# Altium schematic sheet Controller-Sheet-2.SchDoc
size 420 x 297 mm; SheetNumber: 4; SheetTotal: 15
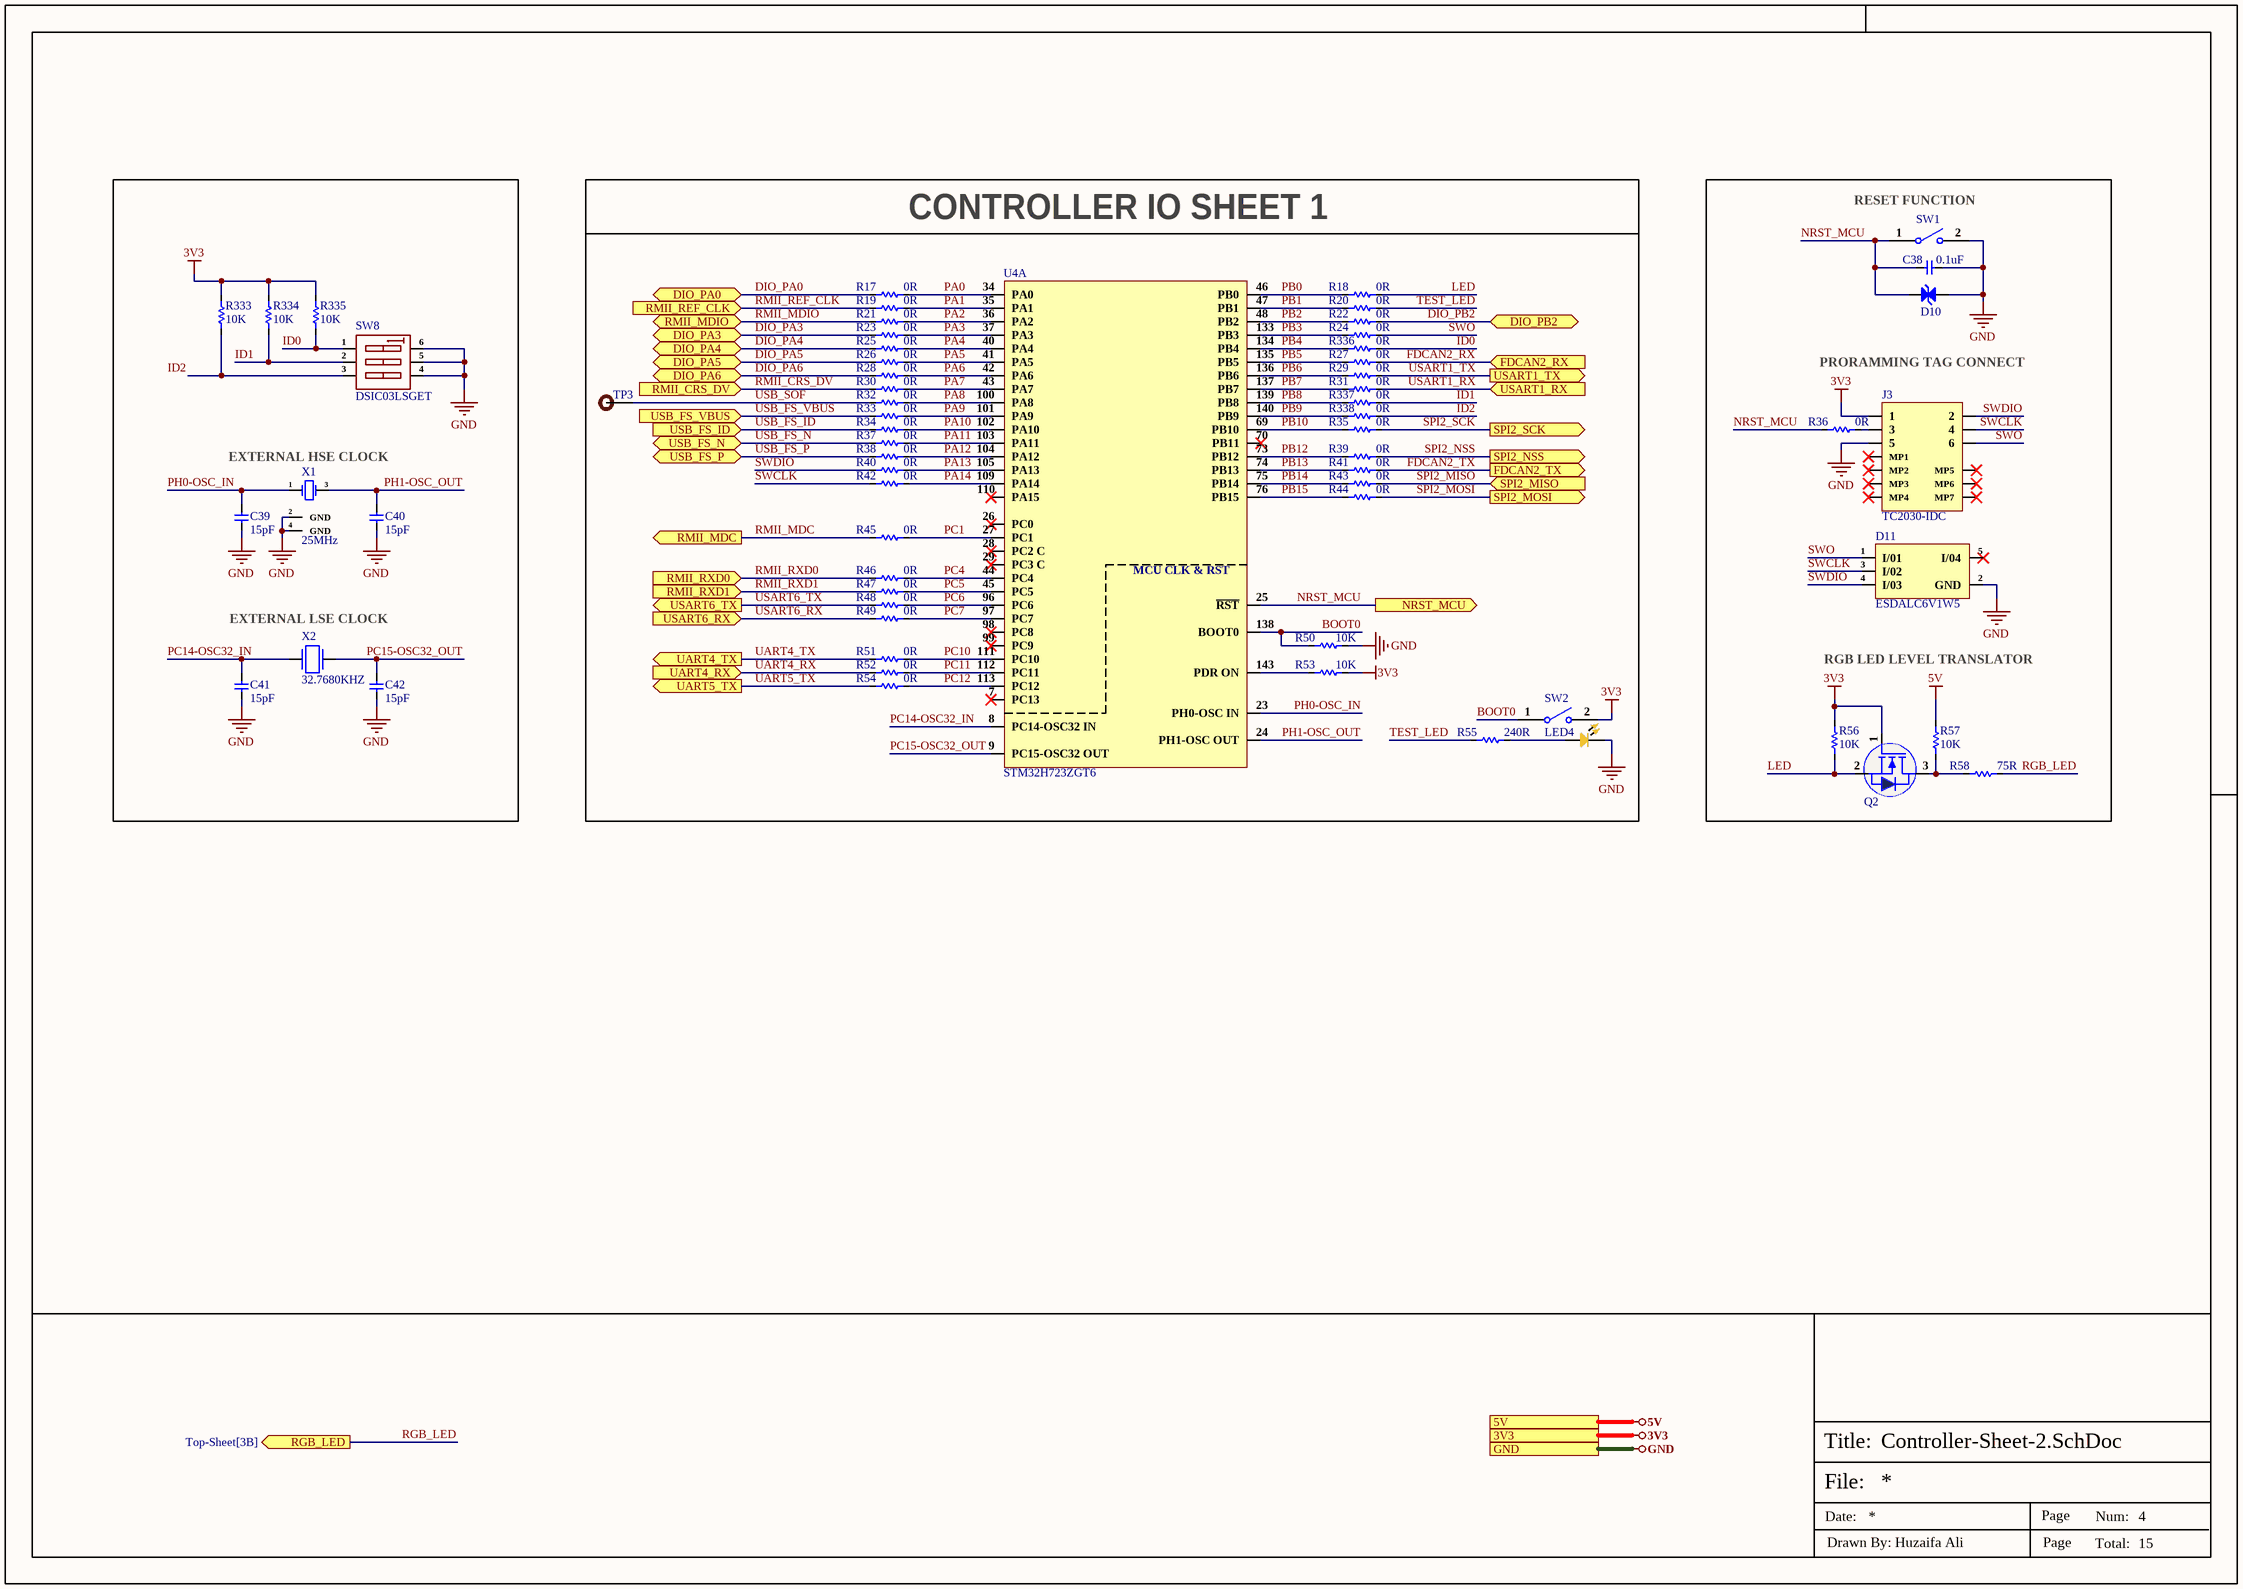
[diagram p0: Controller-Sheet-2.SchDoc]

## Parts
C38  0.1uF  [Cap-0402]
C39  15pF  [Cap-0201]
C40  15pF  [Cap-0201]
C41  15pF  [Cap-0201]
C42  15pF  [Cap-0201]
D10  ESDM2033MX4T5G  [DFN-2(0.3x0.6)]  (value not drawn)
D11  ESDALC6V1W5  [SOT-323-5]
J3  TC2030-IDC  [TC2030-IDC_]
LED4  Yellow  [LED-0603]  (value not drawn)
Q2  Si2302CDS  [Sot-23]  (value not drawn)
R17  0R  [Res-0402]
R18  0R  [Res-0402]
R19  0R  [Res-0402]
R20  0R  [Res-0402]
R21  0R  [Res-0402]
R22  0R  [Res-0402]
R23  0R  [Res-0402]
R24  0R  [Res-0402]
R25  0R  [Res-0402]
R26  0R  [Res-0402]
R27  0R  [Res-0402]
R28  0R  [Res-0402]
R29  0R  [Res-0402]
R30  0R  [Res-0402]
R31  0R  [Res-0402]
R32  0R  [Res-0402]
R33  0R  [Res-0402]
R34  0R  [Res-0402]
R35  0R  [Res-0402]
R36  0R  [Res-0402]
R37  0R  [Res-0402]
R38  0R  [Res-0402]
R39  0R  [Res-0402]
R40  0R  [Res-0402]
R41  0R  [Res-0402]
R42  0R  [Res-0402]
R43  0R  [Res-0402]
R44  0R  [Res-0402]
R45  0R  [Res-0402]
R46  0R  [Res-0402]
R47  0R  [Res-0402]
R48  0R  [Res-0402]
R49  0R  [Res-0402]
R50  10K  [Res-0402]
R51  0R  [Res-0402]
R52  0R  [Res-0402]
R53  10K  [Res-0402]
R54  0R  [Res-0402]
R55  240R  [Res-0402]
R56  10K  [Res-0402]
R57  10K  [Res-0402]
R58  75R  [Res-0402]
R333  10K  [Res-0402]
R334  10K  [Res-0402]
R335  10K  [Res-0402]
R336  0R  [Res-0402]
R337  0R  [Res-0402]
R338  0R  [Res-0402]
SW1  B3U-1000P  [B3U-1000P]  (value not drawn)
SW2  B3U-1000P  [B3U-1000P]  (value not drawn)
SW8  DSIC03LSGET  [DSIC03LSGET]
TP3  TEST POINT 0.5mm Dia  [Test-point - 0.5mm]  (value not drawn)  (no BOM)
U4  STM32H723ZGT6  [LQFP-144(20x20)]  (part A of 3)
X1  25MHz  [Q22FA12800090]
X2  32.7680KHZ  [NX3215SA-32.768K-STD-MUA-8_]

## Blocks framed on the sheet
CONTROLLER IO SHEET 1: LED4 R17-R35 R37-R55 R336-R338 SW2 TP3 U4

## Ports
3V3 (see Top-Sheet[3A], Buttons-Lights-Sensors-Sheet[4D], CAN-Sheet[5D], Controller-Sheet-1[4D], EtherCAT-Sheet[1D], Ethernet-PHY-Sheet[4D], Power-Sheet[4D], RS232-Sheet[5D], RS485-Sheet[5D], USB-Sheet[4D], VFD-Support-Sheet[4D]), 5V (see Top-Sheet[3A], Buttons-Lights-Sensors-Sheet[4D], CAN-Sheet[5D], Power-Sheet[4D], RS232-Sheet[5D], RS485-Sheet[5D], USB-Sheet[4D], VFD-Support-Sheet[4D]), DIO_PA0 (bidir, see Top-Sheet[4A]), DIO_PA3 (bidir, see Top-Sheet[4B]), DIO_PA4 (bidir, see Top-Sheet[3A]), DIO_PA5 (bidir, see Top-Sheet[3A]), DIO_PA6 (bidir, see Top-Sheet[4B]), DIO_PB2 (bidir, see Top-Sheet[4B]), FDCAN2_RX (in, see Top-Sheet[3B]), FDCAN2_TX (out, see Top-Sheet[3B]), GND (see Top-Sheet[3A], Buttons-Lights-Sensors-Sheet[4D], CAN-Sheet[6D], Controller-Sheet-1[4D], Controller-Sheet-3[4D], EtherCAT-Sheet[1D], Ethernet-PHY-Sheet[4D], Extra-DIOs[4D], Power-Sheet[4D], RS232-Sheet[5D], RS485-Sheet[5D], USB-Sheet[4D], VFD-Support-Sheet2[4D], VFD-Support-Sheet[4D]), NRST_MCU (out, see Top-Sheet[3B]), RGB_LED (out, see Top-Sheet[3B]), RMII_CRS_DV (in, see Top-Sheet[3B]), RMII_MDC (out, see Top-Sheet[3B]), RMII_MDIO (bidir, see Top-Sheet[3B]), RMII_REF_CLK (in, see Top-Sheet[3B]), RMII_RXD0 (in, see Top-Sheet[3B]), RMII_RXD1 (in, see Top-Sheet[3B]), SPI2_MISO (in, see Top-Sheet[3A]), SPI2_MOSI (out, see Top-Sheet[3A]), SPI2_NSS (out, see Top-Sheet[3A]), SPI2_SCK (out, see Top-Sheet[3A]), UART4_RX (in, see Top-Sheet[4A]), UART4_TX (out, see Top-Sheet[4A]), UART5_TX (out, see Top-Sheet[3A]), USART1_RX (in, see Top-Sheet[4B]), USART1_TX (out, see Top-Sheet[4B]), USART6_RX (in, see Top-Sheet[3A]), USART6_TX (out, see Top-Sheet[3A]), USB_FS_ID (in, see Top-Sheet[4A], USB-Sheet[1D]), USB_FS_N (bidir, see Top-Sheet[4A], USB-Sheet[1D]), USB_FS_P (bidir, see Top-Sheet[4A], USB-Sheet[1D]), USB_FS_VBUS (in, see Top-Sheet[4A], USB-Sheet[1D])

## Nets
3V3: J3.1 Q2.1(G) R53.1 R56.2 R333.2 R334.2 R335.2 SW2.2 ; port 3V3
5V: R57.2 ; port 5V
GND: C38.1 C39.1 C40.1 C41.1 C42.1 D10.1(A) D11.2(GND) J3.5 LED4.2 R50.1 SW1.2 SW8.4(B3) SW8.5(B2) SW8.6(B1) X1.2(GND) X1.4(GND) ; port GND
BOOT0: R50.2 SW2.1 U4.138(BOOT0)
DIO_PA0: R17.2 ; port DIO_PA0
DIO_PA3: R23.2 ; port DIO_PA3
DIO_PA4: R25.2 ; port DIO_PA4
DIO_PA5: R26.2 ; port DIO_PA5
DIO_PA6: R28.2 ; port DIO_PA6
DIO_PB2: R22.1 ; port DIO_PB2
FDCAN2_RX: R27.1 ; port FDCAN2_RX
FDCAN2_TX: R41.1 ; port FDCAN2_TX
ID0: R335.1 R336.1 SW8.1(A1)
ID1: R334.1 R337.1 SW8.2(A2)
ID2: R333.1 R338.1 SW8.3(A3)
LED: Q2.2(S) R18.1 R56.1
NRST_MCU: C38.2 D10.2(A) R36.2 SW1.1 U4.25(~{RST}) ; port NRST_MCU
PA0: R17.1 U4.34(PA0)
PA1: R19.1 U4.35(PA1)
PA2: R21.1 U4.36(PA2)
PA3: R23.1 U4.37(PA3)
PA4: R25.1 U4.40(PA4)
PA5: R26.1 U4.41(PA5)
PA6: R28.1 U4.42(PA6)
PA7: R30.1 U4.43(PA7)
PA8: R32.1 U4.100(PA8)
PA9: R33.1 U4.101(PA9)
PA10: R34.1 U4.102(PA10)
PA11: R37.1 U4.103(PA11)
PA12: R38.1 U4.104(PA12)
PA13: R40.1 U4.105(PA13)
PA14: R42.1 U4.109(PA14)
PB0: R18.2 U4.46(PB0)
PB1: R20.2 U4.47(PB1)
PB2: R22.2 U4.48(PB2)
PB3: R24.2 U4.133(PB3)
PB4: R336.2 U4.134(PB4)
PB5: R27.2 U4.135(PB5)
PB6: R29.2 U4.136(PB6)
PB7: R31.2 U4.137(PB7)
PB8: R337.2 U4.139(PB8)
PB9: R338.2 U4.140(PB9)
PB10: R35.2 U4.69(PB10)
PB12: R39.2 U4.73(PB12)
PB13: R41.2 U4.74(PB13)
PB14: R43.2 U4.75(PB14)
PB15: R44.2 U4.76(PB15)
PC1: R45.1 U4.27(PC1)
PC4: R46.1 U4.44(PC4)
PC5: R47.1 U4.45(PC5)
PC6: R48.1 U4.96(PC6)
PC7: R49.1 U4.97(PC7)
PC10: R51.1 U4.111(PC10)
PC11: R52.1 U4.112(PC11)
PC12: R54.1 U4.113(PC12)
PC14-OSC32_IN: C41.2 U4.8(PC14-OSC32_IN) X2.2
PC15-OSC32_OUT: C42.2 U4.9(PC15-OSC32_OUT) X2.1
PH0-OSC_IN: C39.2 U4.23(PH0-OSC_IN) X1.1(OSC1)
PH1-OSC_OUT: C40.2 U4.24(PH1-OSC_OUT) X1.3(OSC2)
RGB_LED: R58.2 ; port RGB_LED
RMII_CRS_DV: R30.2 ; port RMII_CRS_DV
RMII_MDC: R45.2 ; port RMII_MDC
RMII_MDIO: R21.2 ; port RMII_MDIO
RMII_REF_CLK: R19.2 ; port RMII_REF_CLK
RMII_RXD0: R46.2 ; port RMII_RXD0
RMII_RXD1: R47.2 ; port RMII_RXD1
SPI2_MISO: R43.1 ; port SPI2_MISO
SPI2_MOSI: R44.1 ; port SPI2_MOSI
SPI2_NSS: R39.1 ; port SPI2_NSS
SPI2_SCK: R35.1 ; port SPI2_SCK
SWCLK: D11.3(I/02) J3.4 R42.2
SWDIO: D11.4(I/03) J3.2 R40.2
SWO: D11.1(I/01) J3.6 R24.1
TEST_LED: R20.1 R55.1
UART4_RX: R52.2 ; port UART4_RX
UART4_TX: R51.2 ; port UART4_TX
UART5_TX: R54.2 ; port UART5_TX
USART1_RX: R31.1 ; port USART1_RX
USART1_TX: R29.1 ; port USART1_TX
USART6_RX: R49.2 ; port USART6_RX
USART6_TX: R48.2 ; port USART6_TX
USB_FS_ID: R34.2 ; port USB_FS_ID
USB_FS_N: R37.2 ; port USB_FS_N
USB_FS_P: R38.2 ; port USB_FS_P
USB_FS_VBUS: R33.2 ; port USB_FS_VBUS
USB_SOF: R32.2 TP3.1
NetJ3_3: J3.3 R36.1
NetLED4_1: LED4.1 R55.2
NetQ2_3: Q2.3(D) R57.1 R58.1
NetR53_2: R53.2 U4.143(PDR_ON)

Not connected (* = marked no-connect by the designer): D11 5(I/04)*; J3 MP1* MP2* MP3* MP4* MP5* MP6* MP7*; U4 7(PC13)* 26(PC0)* 28(PC2_C)* 29(PC3_C)* 70(PB11)* 98(PC8)* 99(PC9)* 110(PA15)*

## Notes on the sheet
- (near SW1) RESET FUNCTION
- PRORAMMING TAG CONNECT
- (near X1) EXTERNAL HSE CLOCK
- (near X2) EXTERNAL LSE CLOCK
- RGB LED LEVEL TRANSLATOR
- File:
- Title:
- Date:
- Page
- Num:
- Total:
- Drawn By: Huzaifa Ali
- (in symbol STM32H723ZGT6, part A) MCU CLK & RST

## Library data of the parts
C38 = CC0402JRX7R7BB104: CAP CER 0.1UF 16V X7R 0402; Manufacturer: Yageo; Material: 4241ConductorMaterial; Value: 100nF; Tolerance: 5%; Item Type: Capacitor; Supplier: Digikey; Supplier Part Number: 311-1676-1-ND; Manufacturer Part Number: CC0402JRX7R7BB104; RoHS: Yes; Category: Ceramic Capacitors; Stock: 1659111; Pricing: 1=0.1, 10=0.046, 50=0.0262, 100=0.0203, 500=0.01528, 1000=0.012, 2500=0.01091, 5000=0.01004 (USD); Mounting Technology: Surface Mount; Case/Package: 0402; Case Code (Metric): 1005; Case Code (Imperial): 0402; Min Operating Temperature: -55°C; Max Operating Temperature: 125°C; Dielectric: X7R; Packaging: Tape and Reel; Package Quantity: 10000; Voltage Rating (DC): 16V; Voltage Rating: 16V; Series: CC; Construction: Flat; Length: 0.039inch; Width: 0.02inch; Height: 0.5mm; Thickness: 0.022inch; Lead Free: Lead Free; Halogen Free: Halogen Free; RoHS Compliant: Yes; ComponentLink1URL: https://datasheet.ciiva.com/13210/upy-gphc-x7r-6-3v-to-50v-8-12304-13210152.pdf?src-supplier=Mouser; ComponentLink1Description: https://datasheet.ciiva.com/13210/upy-gphc-x7r-6-3v-to-50v-8-12304-13210152.pdf?src-supplier=Mouser; LCSC Part Number: C541464
C39-C42 = CC0201JRNPO9BN150: CAP CER 15PF 50V C0G/NPO 0201; Manufacturer: Yageo; Item Type: Capacitor; Supplier: Future Electronics; Supplier Part Number: 2580314; Manufacturer Part Number: CC0201JRNPO9BN150; RoHS: Yes; Category: Ceramic Capacitors; Stock: 585000; Pricing: 15000=0.0012, 60000=0.0011, 225000=0.0011, 600000=0.001, 1500000=0.001 (USD); ComponentLink1URL: https://datasheet.ciiva.com/176/mlccorderingcode-176501.pdf?src-supplier=Digi-Key; ComponentLink1Description: https://datasheet.ciiva.com/176/mlccorderingcode-176501.pdf?src-supplier=Digi-Key; ComponentLink2URL: https://datasheet.ciiva.com/176/mlccorderingcode-176502.pdf?src-supplier=Digi-Key; ComponentLink2Description: https://datasheet.ciiva.com/176/mlccorderingcode-176502.pdf?src-supplier=Digi-Key; ComponentLink3URL: https://datasheet.ciiva.com/176/mlccorderingcode-176503.pdf?src-supplier=Digi-Key; ComponentLink3Description: https://datasheet.ciiva.com/176/mlccorderingcode-176503.pdf?src-supplier=Digi-Key; ComponentLink4URL: https://datasheet.ciiva.com/17205/upy-gp-np0-16v-to-50v-8-17205625.pdf?src-supplier=Future+Electronics; ComponentLink4Description: https://datasheet.ciiva.com/17205/upy-gp-np0-16v-to-50v-8-17205625.pdf?src-supplier=Future+Electronics; LCSC Part Number: C277480
D10 = ESDM2033MX4T5G: DIODE BIDIR ESD X4DFN2; Manufacturer: ON Semiconductor; Item Type: (TVS/ESD); Supplier: Avnet; LCSC Part Number: C896720; Manufacturer Part Number: ESDM2033MX4T5G; RoHS: Yes; Stock: 629400; Pricing: 8961=0.04129, 9000=0.04018, 18000=0.03906, 45000=0.03794, 90000=0.03683, 450000=0.03571, 900000=0.0346 (USD); Series: -
D11 = ESDALC6V1W5: TVS DIODE 3VWM SOT323-5; Manufacturer: STMicroelectronics; Item Type: TVS Diodes; Supplier: Future Electronics; LCSC Part Number: C703691; Manufacturer Part Number: ESDALC6V1W5; RoHS: Yes; Stock: 3000; Pricing: 3000=0.0569, 9000=0.0547, 12000=0.0774, 15000=0.0538, 30000=0.0749, 45000=0.0518, 75000=0.05 (USD); ComponentLink1URL: https://datasheet.ciiva.com/23847/cd00002946-23847220.pdf?src-supplier=Newark; ComponentLink1Description: https://datasheet.ciiva.com/23847/cd00002946-23847220.pdf?src-supplier=Newark; ComponentLink2URL: https://datasheet.ciiva.com/4509/cd00002946-81943-4509940.pdf?src-supplier=Mouser; ComponentLink2Description: https://datasheet.ciiva.com/4509/cd00002946-81943-4509940.pdf?src-supplier=Mouser; ComponentLink3URL: https://datasheet.ciiva.com/5782/cd00002946-5782886.pdf?src-supplier=Farnell; ComponentLink3Description: https://datasheet.ciiva.com/5782/cd00002946-5782886.pdf?src-supplier=Farnell; ComponentLink4URL: https://datasheet.ciiva.com/338/cd00002946-338376.pdf?src-supplier=Digikey; ComponentLink4Description: https://datasheet.ciiva.com/338/cd00002946-338376.pdf?src-supplier=Digikey; ComponentLink5URL: https://datasheet.ciiva.com/338/cd00002946-338377.pdf?src-supplier=Digikey; ComponentLink5Description: https://datasheet.ciiva.com/338/cd00002946-338377.pdf?src-supplier=Digikey; ComponentLink6URL: https://datasheet.ciiva.com/338/cd00002946-338378.pdf?src-supplier=Digikey; ComponentLink6Description: https://datasheet.ciiva.com/338/cd00002946-338378.pdf?src-supplier=Digikey
J3 = TC2030-IDC: CABLE ADAPTER 6 POS; Manufacturer: Tag-Connect; ComponentLink1URL: http://www.tag-connect.com/Materials/TC2030-MCP%20Datasheet.pdf?src-supplier=Digi-Key; ComponentLink1Description: http://www.tag-connect.com/Materials/TC2030-MCP%20Datasheet.pdf?src-supplier=Digi-Key; Supplier 1: Digi-Key; Manufacturer Part Number: TC2030-IDC; Stock 1: 284; Pricing 1: 1=43.71 (USD); Package Quantity: 1; Supplier Part Number 1: TC2030-IDC-ND
LED4 = NCD0603Y2: yellow 0603 Light Emitting Diodes (LED) ROHS; Manufacturer: Foshan NationStar Optoelectronics; Manufacturer Part Number: NCD0603Y2; Package: 0603; LCSC Part Number: C89811; Item Type: LED; ComponentLink1Description: LCSC; ComponentLink1URL: https://www.lcsc.com/product-detail/Light-Emitting-Diodes-LED_Foshan-NationStar-Optoelectronics-NCD0603Y2_C89811.html
Q2 = Si2302CDS: N-CHANNEL 20-V (D-S) MOSFET; Manufacturer: TECH PUBLIC; ComponentLink1Description: LCSC; ComponentLink1URL: https://www.lcsc.com/product-detail/MOSFETs_TECH-PUBLIC-SI2302CDS_C5310968.html; Manufacturer Part Number: SI2302CDS; Package: SOT-23; LCSC Part Number: C5310968; Item Type: Mosfet
R17-R49 R51 R52 R54 R336-R338 = RC0402FR-070RL: RES 0 OHM JUMPER 1/16W 0402; Manufacturer: Yageo; Item Type: Resistors; Tolerance: 1%; Power Rating: 62.5mW; Voltage Rating: 50V; Temperature Coefficient: 200ppm/°C; Max Power Dissipation: 63mW; Supplier 1: Mouser; Manufacturer Part Number: RC0402FR-070RL; RoHS: Yes; Stock 1: 8556842; Pricing 1: 1=0.10000, 10=0.01400, 50=0.01400, 100=0.00600, 1000=0.00300, 5000=0.00200, 10000=0.00100 (USD); Mount: Surface Mount; Case/Package: 0402; Contact Plating: Tin,Matte; Case Code (Imperial): 0402; Case Code (Metric): 1005; Size Code: 0402; Min Operating Temperature: -55°C; Max Operating Temperature: 155°C; Resistance: 0R; Resistor Type: Thick Film; Packaging: Tape and Reel; Termination: SMD/SMT; Features: Moisture Resistant; Series: RC; Number of Terminations: 2; Length: 1mm; Width: 0.5mm; Height: 0.35mm; Radiation Hardening: No; Lead Free: Lead Free; RoHS Compliant: Yes; ComponentLink1URL: https://datasheet.ciiva.com/8896/pyu-rc0402-51-rohs-l-6-8896149.pdf?src-supplier=Avnet; ComponentLink1Description: https://datasheet.ciiva.com/8896/pyu-rc0402-51-rohs-l-6-8896149.pdf?src-supplier=Avnet; ComponentLink2URL: https://datasheet.ciiva.com/16790/pyu-rc0402-51-rohs-l-6-r-16790444.pdf?src-supplier=Future+Electronics; ComponentLink2Description: https://datasheet.ciiva.com/16790/pyu-rc0402-51-rohs-l-6-r-16790444.pdf?src-supplier=Future+Electronics; Supplier Part Number 1: 603-RC0402FR-070RL; LCSC Part Number: C106231
R50 R53 R56 R57 R333-R335 = RC0402FR-0710KL: RES 10K OHM 1% 1/16W 0402; Manufacturer: Yageo; Resistance: 10kR; Voltage Rating (DC): 50V; Temperature Coefficient: 100ppm/°C; Power Rating: 62.5mW; Max Power Dissipation: 63mW; Item Type: Resistor; Supplier 1: Mouser; Manufacturer Part Number: RC0402FR-0710KL; RoHS: Yes; Category: Chip SMD Resistors; Stock 1: 18648329; Pricing 1: 1=0.10000, 10=0.01400, 50=0.01400, 100=0.00500, 1000=0.00300, 10000=0.00200 (USD); Case/Package: 0402; Number of Pins: 2; Case Code (Imperial): 0402; Case Code (Metric): 1005; Min Operating Temperature: -55°C; Max Operating Temperature: 155°C; Resistor Type: Thick Film; Tolerance: 1%; Packaging: Tape and Reel; Voltage Rating: 50V; Termination: SMD/SMT; Working Voltage: 50V; Number of Terminations: 2; Features: Moisture Resistant; Series: RC; Resistance Tolerance: 1%; Construction: Rectangular; Length: 1mm; Width: 0.5mm; Height: 0.32mm; Depth: 0.5mm; Lead Pitch: 0.2mm; REACH SVHC: No SVHC; Lead Free: Lead Free; RoHS Compliant: Yes; Military Standard: Not; ComponentLink1URL: https://datasheet.ciiva.com/7660/38568-7660787.pdf?src-supplier=Element14; ComponentLink1Description: https://datasheet.ciiva.com/7660/38568-7660787.pdf?src-supplier=Element14; ComponentLink2URL: https://datasheet.ciiva.com/7849/1686128-7849814.pdf?src-supplier=Element14; ComponentLink2Description: https://datasheet.ciiva.com/7849/1686128-7849814.pdf?src-supplier=Element14; ComponentLink3URL: https://datasheet.ciiva.com/7983/1018594-7983486.pdf?src-supplier=Element14; ComponentLink3Description: https://datasheet.ciiva.com/7983/1018594-7983486.pdf?src-supplier=Element14; ComponentLink4URL: https://datasheet.ciiva.com/22747/1018594-22747512.pdf?src-supplier=Element14; ComponentLink4Description: https://datasheet.ciiva.com/22747/1018594-22747512.pdf?src-supplier=Element14; ComponentLink5URL: https://datasheet.ciiva.com/12667/pyu-rc0402-51-rohs-l-6-r-12667067.pdf?src-supplier=Mouser; ComponentLink5Description: https://datasheet.ciiva.com/12667/pyu-rc0402-51-rohs-l-6-r-12667067.pdf?src-supplier=Mouser; ComponentLink6URL: https://datasheet.ciiva.com/7849/1784430-7849813.pdf?src-supplier=Element14; ComponentLink6Description: https://datasheet.ciiva.com/7849/1784430-7849813.pdf?src-supplier=Element14; ComponentLink7URL: https://datasheet.ciiva.com/7849/1784430-7849815.pdf?src-supplier=Element14; ComponentLink7Description: https://datasheet.ciiva.com/7849/1784430-7849815.pdf?src-supplier=Element14; Supplier Part Number 1: 603-RC0402FR-0710KL; LCSC Part Number: C60490
R55 = RC0402FR-07240RL: RES 240 OHM 1% 1/16W 0402; Manufacturer: Yageo; Item Type: Resistors; Power Rating: 63mW; Temperature Coefficient: 100ppm/°C; Voltage Rating (DC): 50V; Supplier 1: Mouser; Manufacturer Part Number: RC0402FR-07240RL; RoHS: Yes; Stock 1: 1903202; Pricing 1: 1=0.10000, 10=0.01200, 50=0.01200, 100=0.00500, 1000=0.00300, 10000=0.00100 (USD); Case/Package: 0402; Case Code (Metric): 1005; Case Code (Imperial): 0402; Size Code: 0402; Min Operating Temperature: -55°C; Max Operating Temperature: 155°C; Resistance: 240R; Tolerance: 1%; Packaging: Tape and Reel; Resistor Type: Thick Film; Voltage Rating: 50V; Package Quantity: 1; Number of Terminations: 2; Termination: SMD/SMT; Max Power Dissipation: 63mW; Features: Moisture Resistant; Series: RC; Construction: Rectangular; Resistance Tolerance: 1%; Length: 1mm; Width: 0.02inch; Height: 0.016inch; Depth: 0.5mm; REACH SVHC: Unknown; Lead Free: Lead Free; RoHS Compliant: Yes; Military Standard: Not; ComponentLink1URL: https://datasheet.ciiva.com/7849/1018594-7849915.pdf?src-supplier=Element14; ComponentLink1Description: https://datasheet.ciiva.com/7849/1018594-7849915.pdf?src-supplier=Element14; ComponentLink2URL: https://datasheet.ciiva.com/7849/1018594-7849916.pdf?src-supplier=Element14; ComponentLink2Description: https://datasheet.ciiva.com/7849/1018594-7849916.pdf?src-supplier=Element14; ComponentLink3URL: https://datasheet.ciiva.com/2519/pyu-r-int-thick-7-2519157.pdf?src-supplier=Digi-Key; ComponentLink3Description: https://datasheet.ciiva.com/2519/pyu-r-int-thick-7-2519157.pdf?src-supplier=Digi-Key; ComponentLink4URL: https://datasheet.ciiva.com/2519/pyu-r-int-thick-7-2519158.pdf?src-supplier=Digi-Key; ComponentLink4Description: https://datasheet.ciiva.com/2519/pyu-r-int-thick-7-2519158.pdf?src-supplier=Digi-Key; ComponentLink5URL: https://datasheet.ciiva.com/2519/pyu-r-int-thick-7-2519156.pdf?src-supplier=Digi-Key; ComponentLink5Description: https://datasheet.ciiva.com/2519/pyu-r-int-thick-7-2519156.pdf?src-supplier=Digi-Key; ComponentLink6URL: https://datasheet.ciiva.com/12669/pyu-rc0402-51-rohs-l-6-r-12669689.pdf?src-supplier=Mouser; ComponentLink6Description: https://datasheet.ciiva.com/12669/pyu-rc0402-51-rohs-l-6-r-12669689.pdf?src-supplier=Mouser; ComponentLink7URL: https://datasheet.ciiva.com/17419/pyu-rc0402-51-rohs-l-6-r-17419482.pdf?src-supplier=Future+Electronics; ComponentLink7Description: https://datasheet.ciiva.com/17419/pyu-rc0402-51-rohs-l-6-r-17419482.pdf?src-supplier=Future+Electronics; Supplier Part Number 1: 603-RC0402FR-07240RL; LCSC Part Number: C114755
R58 = RC0402JR-0775RL: RES 75 OHM 5% 1/16W 0402; Manufacturer: Yageo; Item Type: Resistor; Temperature Coefficient: 100ppm/°C; Power Rating: 62.5mW; Voltage Rating: 50V; Max Power Dissipation: 63mW; Supplier: Digikey; Supplier Part Number: 311-75JRCT-ND; Manufacturer Part Number: RC0402JR-0775RL; RoHS: Yes; Stock: 2993323; Pricing: 1=0.1, 10=0.018, 50=0.0102, 100=0.0083, 500=0.00528, 1000=0.00444, 5000=0.00307 (USD); Case/Package: 0402; Pins: 2; Contact Plating: Tin,Lead; Case Code (Imperial): 0402; Case Code (Metric): 1005; Min Operating Temperature: -55°C; Max Operating Temperature: 155°C; Value: 75R; Tolerance: 5%; Resistor Type: Thick Film; Packaging: Tape and Reel; Termination: SMD/SMT; Voltage Rating (DC): 50V; Features: Moisture Resistant; Series: RC; Number of Terminations: 2; Resistance Tolerance: 5%; Length: 1mm; Width: 0.5mm; Height: 0.35mm; Reach SVHC Compliant: No; Lead Free: Lead Free; RoHS Compliant: Yes; ComponentLink1URL: https://datasheet.ciiva.com/7983/1018594-7983612.pdf?src-supplier=Element14; ComponentLink1Description: https://datasheet.ciiva.com/7983/1018594-7983612.pdf?src-supplier=Element14; ComponentLink2URL: https://datasheet.ciiva.com/17082/pyu-rc0402-51-rohs-l-6-r-17082239.pdf?src-supplier=Future+Electronics; ComponentLink2Description: https://datasheet.ciiva.com/17082/pyu-rc0402-51-rohs-l-6-r-17082239.pdf?src-supplier=Future+Electronics; LCSC Part Number: C137841
SW1 SW2 = B3U-1000P: SWITCH TACTILE SPST-NO 0.05A 12V; Manufacturer: Omron; Mechanical Life: 200000Cycles; Operating Force: 1.5N; Throw Configuration: SPST; Current Rating: 50mA; Contact Resistance: 100mR; Illumination Type: Non-Illuminated,Illuminated; Switch Travel: 0.15mm; Switch Function: Off-Mom; Actuator Type: Standard; Actuator Length: 0.4mm; Ratings: Dust Proof,IP40; ComponentLink1URL: http://www.farnell.com/datasheets/60838.pdf?src-supplier=Farnell; ComponentLink1Description: http://www.farnell.com/datasheets/60838.pdf?src-supplier=Farnell; ComponentLink2URL: http://www.farnell.com/datasheets/60838.pdf?src-supplier=Element14; ComponentLink2Description: http://www.farnell.com/datasheets/60838.pdf?src-supplier=Element14; ComponentLink3URL: https://omronfs.omron.com/en_US/ecb/products/pdf/en-b3u.pdf?src-supplier=Digi-Key; ComponentLink3Description: https://omronfs.omron.com/en_US/ecb/products/pdf/en-b3u.pdf?src-supplier=Digi-Key; ComponentLink4URL: http://www.omron.com/ecb/products/pdf/en-b3u.pdf?src-supplier=Digi-Key; ComponentLink4Description: http://www.omron.com/ecb/products/pdf/en-b3u.pdf?src-supplier=Digi-Key; ComponentLink5URL: https://www.distrelec.biz/Web/Downloads/he/et/B3U_eng_datasheet.pdf?mime=application%2Fpdf&src-supplier=Distrelec; ComponentLink5Description: https://www.distrelec.biz/Web/Downloads/he/et/B3U_eng_datasheet.pdf?mime=application%2Fpdf&src-supplier=Distrelec; ComponentLink6URL: http://www.onlinecomponents.com/productFiles/mf-OM/en-b3u.pdf?src-supplier=Onlinecomponents.com; ComponentLink6Description: http://www.onlinecomponents.com/productFiles/mf-OM/en-b3u.pdf?src-supplier=Onlinecomponents.com; Supplier 1: Digi-Key; Manufacturer Part Number: B3U-1000P; Stock 1: 116454; Pricing 1: 1=1, 10=0.961, 25=0.9064, 50=0.7976, 100=0.7251, 250=0.68888, 500=0.67074, 1000=0.52571 (USD); Mount: Surface Mount; Weight: 0.000776oz; Contact Material: Silver; Min Operating Temperature: -25°C; Max Operating Temperature: 70°C; Packaging: Tape and Reel; Voltage Rating (DC): 12V; Package Quantity: 1; Max Current Rating: 50mA; Termination: SMD/SMT; Orientation: Straight; Max Voltage Rating (DC): 12V; Electrical Life: 200000Cycles; Insulation Resistance: 100MR; Contact Current Rating: 50mA; Length: 4mm; Height: 1.2mm; Depth: 2.5mm; Width: 3mm; REACH SVHC: Unknown; Lead Free: Lead Free; ComponentLink7URL: https://www.verical.com/server-webapp/html/getDatasheet?partID=552554&src-supplier=Verical; ComponentLink7Description: https://www.verical.com/server-webapp/html/getDatasheet?partID=552554&src-supplier=Verical; ComponentLink8URL: http://www.farnell.com/datasheets/1685550.pdf?src-supplier=Element14; ComponentLink8Description: http://www.farnell.com/datasheets/1685550.pdf?src-supplier=Element14; ComponentLink9URL: http://www.farnell.com/datasheets/2610940.pdf?src-supplier=Farnell; ComponentLink9Description: http://www.farnell.com/datasheets/2610940.pdf?src-supplier=Farnell; ComponentLink10URL: https://www.alliedelec.com/m/d/4c8a9ef82804fc3c241a13c1e298fd73.pdf?src-supplier=Allied+Electronics; ComponentLink10Description: https://www.alliedelec.com/m/d/4c8a9ef82804fc3c241a13c1e298fd73.pdf?src-supplier=Allied+Electronics; Supplier Part Number 1: SW1020DKR-ND; LCSC Part Number: C231329; Item Type: Switch
SW8 = DSIC03LSGET: 3 positions SPST Black Flat Toggle, Raised Style SMD-6P,6x7.6mm DIP Switches ROHS; Manufacturer: DongGuan KINGTEK Industrial Co.,LTD; Manufacturer Part Number: DSIC03LSGET; Package: SMD-6P,6x7.6mm; LCSC Part Number: C57453; Item Type: DIP Switches; ComponentLink1Description: LCSC; ComponentLink1URL: https://www.lcsc.com/product-detail/DIP-Switches_DongGuan-KINGTEK-Industrial-Co-LTD-DSIC03LSGET_C57453.html
TP3 = TEST POINT 0.5mm Dia: Test Point ON; Item Type: Test Point; Manufacturer Part Number: TEST POINT 0.5mm Dia
U4 = STM32H723ZGT6: IC MCU 32BIT 1MB FLASH 144LQFP; Manufacturer: STMicroelectronics; Interface: 39,40,224,1514,1515,1518,1532,1533Interface; Memory Format: 4498,11064MemoryType; Data Bus Width: 32b; Frequency: 550MHz; Max Supply Voltage: 3.6V; Min Supply Voltage: 1.62V; Nominal Supply Current: 4uA; Number of A/D Converters: 1NUMBER; Number of ADC Channels: 16NUMBER; Number of I2C Channels: 5NUMBER; Number of I/Os: 112NUMBER; Number of SPI Channels: 6NUMBER; Number of Timers/Counters: 4NUMBER; RAM Size: 564KB; Supplier: Future Electronics; LCSC Part Number: C730146; Manufacturer Part Number: STM32H723ZGT6; RoHS: No; Item Type: IC; Stock: 4380; Pricing: 60=7.31, 120=7.27, 180=7.25, 240=7.23, 300=7.18 (USD); Min Operating Temperature: -40°C; Max Operating Temperature: 85°C; Density: 1MB; Memory Size: 1MB; Number of Ethernet Channels: 1NUMBER; Number of UART Channels: 6NUMBER; Number of USB Channels: 1NUMBER; Height: 1.6mm
X1 = Q22FA12800090: CRYSTAL 25.0000MHZ 12PF SMD; Manufacturer: Seiko Epson; ComponentLink1Description: LCSC; ComponentLink1URL: https://www.lcsc.com/product-detail/Crystals_Seiko-Epson-Q22FA12800090_C255883.html; Manufacturer Part Number: Q22FA12800090; Package: SMD2016-4P; LCSC Part Number: C255883; Item Type: Crystal
X2 = NX3215SA-32.768K-STD-MUA-8: CRYSTAL 32.7680KHZ 12.5PF SMD; Manufacturer: NDK; Frequency: 32.768kHz; Frequency Tolerance: 20ppm; ESR (Equivalent Series Resistance): 70kR; Supplier 1: Digi-Key; Manufacturer Part Number: NX3215SA-32.768K-STD-MUA-8; Stock 1: 29951; Pricing 1: 1=0.68, 10=0.602, 50=0.5628, 100=0.4974, 500=0.47124, 1000=0.3927 (USD); Mount: Surface Mount; Case/Package: SMD/SMT; Number of Pins: 2; Min Operating Temperature: -40°C; Max Operating Temperature: 85°C; Package Quantity: 1000; Load Capacitance: 12.5pF; Packaging: Tape and Reel; Length: 0.126inch; Height: 0.035inch; Width: 0.059inch; Lead Free: Lead Free; ComponentLink1URL: https://media.digikey.com/pdf/Data%20Sheets/NDK%20PDFs/NX3215SA-32.768K-STD-MUA-8.pdf?src-supplier=Digi-Key; ComponentLink1Description: https://media.digikey.com/pdf/Data%20Sheets/NDK%20PDFs/NX3215SA-32.768K-STD-MUA-8.pdf?src-supplier=Digi-Key; ComponentLink2URL: http://www.ndk.com/images/products/catalog/c_NX3215SA-STD-MUA-14_e.pdf?src-supplier=Digi-Key; ComponentLink2Description: http://www.ndk.com/images/products/catalog/c_NX3215SA-STD-MUA-14_e.pdf?src-supplier=Digi-Key; Supplier Part Number 1: 644-1156-6-ND; LCSC Part Number: C156245